# Altium schematic sheet stm32-electronic-dice_E3_schematic.SchDoc: Игральные кости на базе
size 420 x 297 mm; CheckedBy: Чистяков М.Г.; Author: Советников М.М.; DocumentNumber: ИУ4.11.03.03.25.06.62.18.001 Э3; SheetNumber: 3; SheetTotal: 3; FirstReferrence: ИУ4.11.03.03.25.06.62.18.001; Group: Группа ИУ4-62Б; Title2str: микрокроконтроллера STM32F103C8T6; DocumentType: Схема электрическая принципиальная
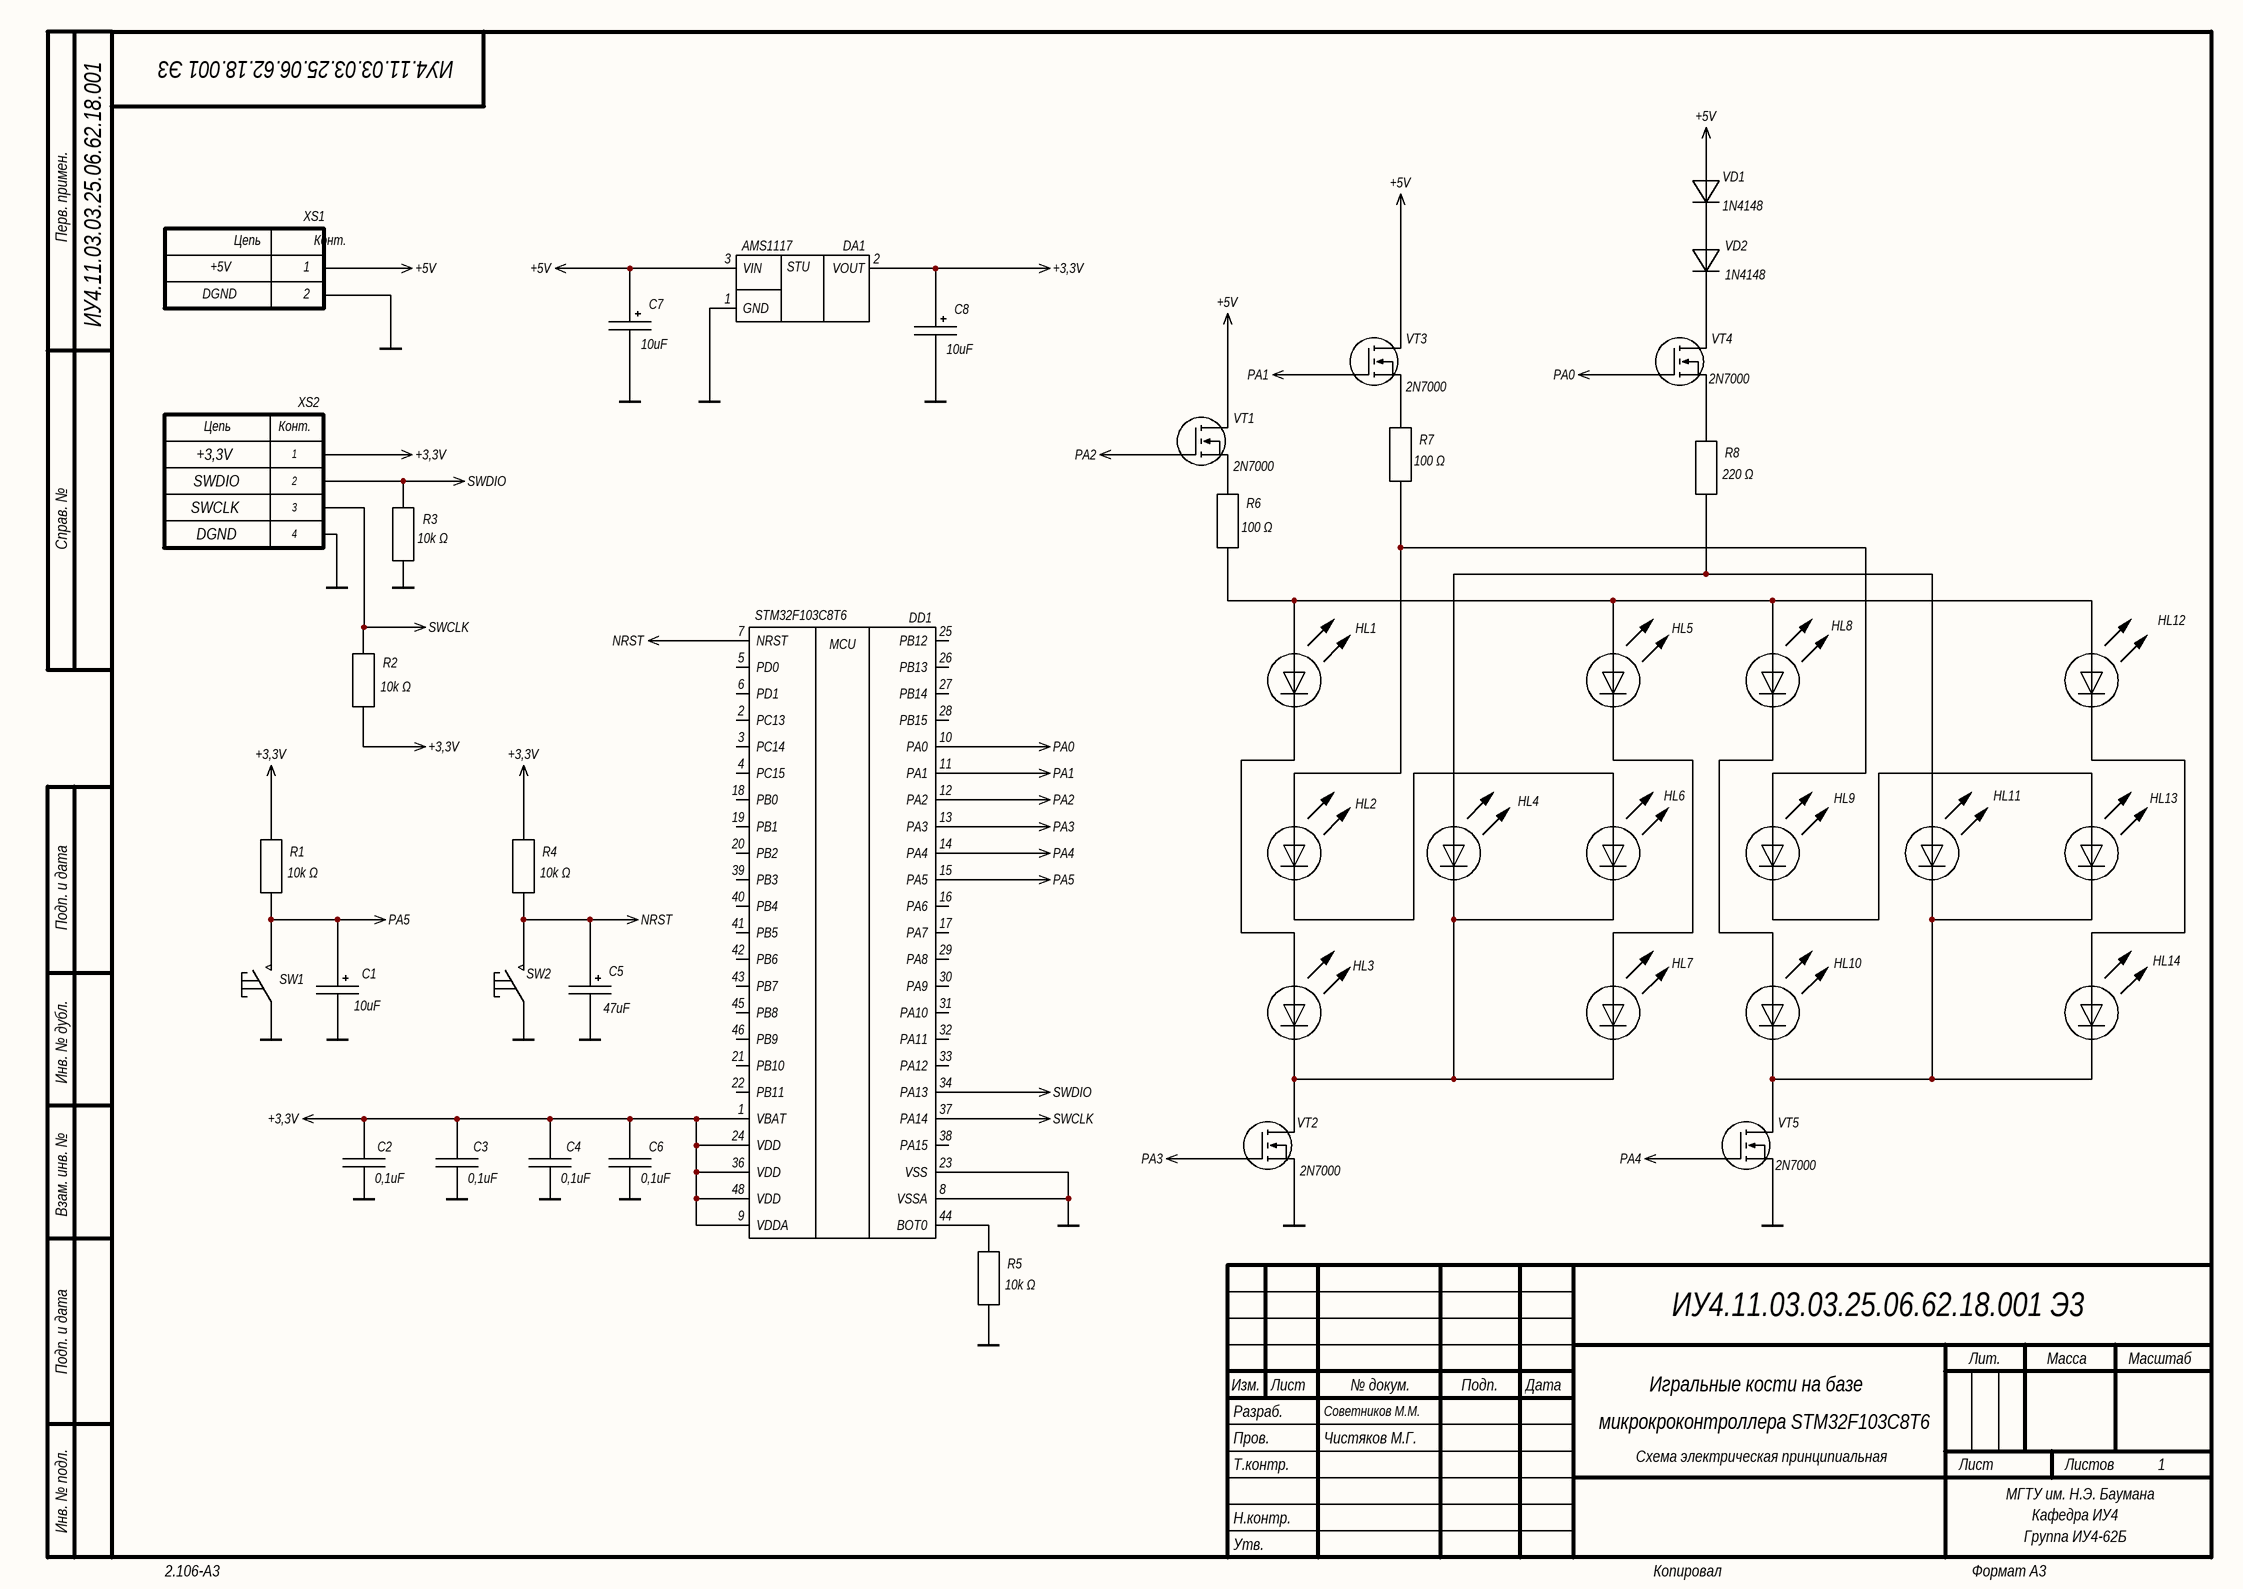
[diagram p0: stm32-electronic-dice_E3_schematic.SchDoc]

## Parts
C1  10uF  [C_KM50-35]
C2  0,1uF  [C_KM5B_1000]
C3  0,1uF  [C_KM5B_1000]
C4  0,1uF  [C_KM5B_1000]
C5  47uF  [C_KM50-35]
C6  0,1uF  [C_KM5B_1000]
C7  10uF  [C_KM50-35]
C8  10uF  [C_KM50-35]
DA1  AMS1117  [DA_SOT-223]
DD1  STM32F103C8T6  [DD_LQFP-48]
HL1  HL_LED  [HL_LED_3MM]  (value not drawn)
HL2  HL_LED  [HL_LED_3MM]  (value not drawn)
HL3  HL_LED  [HL_LED_3MM]  (value not drawn)
HL4  HL_LED  [HL_LED_3MM]  (value not drawn)
HL5  HL_LED  [HL_LED_3MM]  (value not drawn)
HL6  HL_LED  [HL_LED_3MM]  (value not drawn)
HL7  HL_LED  [HL_LED_3MM]  (value not drawn)
HL8  HL_LED  [HL_LED_3MM]  (value not drawn)
HL9  HL_LED  [HL_LED_3MM]  (value not drawn)
HL10  HL_LED  [HL_LED_3MM]  (value not drawn)
HL11  HL_LED  [HL_LED_3MM]  (value not drawn)
HL12  HL_LED  [HL_LED_3MM]  (value not drawn)
HL13  HL_LED  [HL_LED_3MM]  (value not drawn)
HL14  HL_LED  [HL_LED_3MM]  (value not drawn)
R1  10k Ω  [R_CF-25_C1-4]
R2  10k Ω  [R_CF-25_C1-4]
R3  10k Ω  [R_CF-25_C1-4]
R4  10k Ω  [R_CF-25_C1-4]
R5  10k Ω  [R_CF-25_C1-4]
R6  100 Ω  [R_CF-25_C1-4]
R7  100 Ω  [R_CF-25_C1-4]
R8  220 Ω  [R_CF-25_C1-4]
SW1  SW_Switch  [SW_Button]  (value not drawn)
SW2  SW_Switch  [SW_Button]  (value not drawn)
VD1  1N4148  [VD_DO-35]
VD2  1N4148  [VD_DO-35]
VT1  2N7000  [VT_TO-92]
VT2  2N7000  [VT_TO-92]
VT3  2N7000  [VT_TO-92]
VT4  2N7000  [VT_TO-92]
VT5  2N7000  [VT_TO-92]
XS1  2Pin 5.0mm  [X_2Pin_5.0mm]  (value not drawn)
XS2  4Pin 5.0mm  [X_4Pin_5.0mm]  (value not drawn)

## Nets
+3,3V: C2.1 C3.1 C4.1 C6.1 C8.1 DA1.2(VOUT) DD1.1(VBAT) DD1.9(VDDA) DD1.24(VDD) DD1.36(VDD) DD1.48(VDD) R1.2 R2.1 R4.2 XS2.1
+5V: C7.1 DA1.3(VIN) VD1.1 VT1.3(С) VT3.3(С) XS1.1
DGND: C1.2 C2.2 C3.2 C4.2 C5.2 C6.2 C7.2 C8.2 DA1.1(GND) DD1.8(VSSA) DD1.23(VSS) R3.1 R5.1 SW1.1 SW2.1 VT2.1(И) VT5.1(И) XS1.2 XS2.4
NRST: C5.1 DD1.7(NRST) R4.1 SW2.2
PA0: DD1.10(PA0) VT4.2(З)
PA1: DD1.11(PA1) VT3.2(З)
PA2: DD1.12(PA2) VT1.2(З)
PA3: DD1.13(PA3) VT2.2(З)
PA4: DD1.14(PA4) VT5.2(З)
PA5: C1.1 DD1.15(PA5) R1.1 SW1.2
SWCLK: DD1.37(PA14) R2.2 XS2.3
SWDIO: DD1.34(PA13) R3.2 XS2.2
NetDD1_44: DD1.44(BOT0) R5.2
NetHL1_1: HL1.1 HL5.1 HL8.1 HL12.1 R6.1
NetHL1_2: HL1.2 HL3.1
NetHL2_1: HL2.1 HL9.1 R7.1
NetHL2_2: HL2.2 HL6.1
NetHL3_2: HL3.2 HL4.2 HL6.2 HL7.2 VT2.3(С)
NetHL4_1: HL4.1 HL11.1 R8.1
NetHL5_2: HL5.2 HL7.1
NetHL8_2: HL8.2 HL10.1
NetHL9_2: HL9.2 HL13.1
NetHL10_2: HL10.2 HL11.2 HL13.2 HL14.2 VT5.3(С)
NetHL12_2: HL12.2 HL14.1
NetR6_2: R6.2 VT1.1(И)
NetR7_2: R7.2 VT3.1(И)
NetR8_2: R8.2 VT4.1(И)
NetVD1_2: VD1.2 VD2.1
NetVD2_2: VD2.2 VT4.3(С)

Not connected (* = marked no-connect by the designer): DD1 2(PC13) 3(PC14) 4(PC15) 5(PD0) 6(PD1) 16(PA6) 17(PA7) 18(PB0) 19(PB1) 20(PB2) 21(PB10) 22(PB11) 25(PB12) 26(PB13) 27(PB14) 28(PB15) 29(PA8) 30(PA9) 31(PA10) 32(PA11) 33(PA12) 38(PA15) 39(PB3) 40(PB4) 41(PB5) 42(PB6) 43(PB7) 45(PB8) 46(PB9)

## Notes on the sheet
- DGND
- +5V
- +3,3V
- SWCLK
- SWDIO
- Перв. примен.
- Справ. №
- Подп. и дата
- Инв. № дубл.
- Взам. инв. №
- Разраб.
- Изм.
- Лист
- № докум.
- Подп.
- Дата
- Лит.
- Масса
- Масштаб
- Пров.
- Т.контр.
- Листов
- 1
- Инв. № подл.
- Утв.
- Н.контр.
- Кафедра ИУ4
- МГТУ им. Н.Э. Баумана
- 2.106-A3
- Копировал
- Формат А3
- (in symbol DA_AMS1117) STU
- (in symbol DD_STM32F103C8T6) MCU
- (in symbol XS_Connector_2Pin) Цепь; Конт.
- (in symbol XS_Connector_4Pin) Цепь; Конт.

## Library data of the parts
C1 C5 C7 C8 = C_Polarized: Polarized capacitor
  C1 C7 C8: Value: 10uF
  C5: Value: 47uF
C2-C4 C6 = C_NonPolarized: Non-polarized capacitor; Value: 0,1uF
DA1 = DA_AMS1117: Linear voltage regulator, AMS1117 3,3V
DD1 = DD_STM32F103C8T6: STM32F103C8T6 microcontroller, LQFP-48 package
HL1-HL14 = HL_LED: Light-emitting diode (LED)
R1-R8 = R_Resistor: Fixed resistor
  R1-R5: Value: 10k Ω
  R6 R7: Value: 100 Ω
  R8: Value: 220 Ω
SW1 SW2 = SW_Switch: Switch
VD1 VD2 = VD_Diode: Diode
VT1-VT5 = VT_MOSFET_NChannel: N-channel MOSFET; Value: 2N7000
XS1 = XS_Connector_2Pin: 2-pin connector (socket); Value: *
XS2 = XS_Connector_4Pin: 4-pin connector (socket)